# EasyEDA Pro project energymonitor_2025-05-27.epro, schematic Schematic_1, sheets 1 to 3 of 6

## Sheets
1 P1: Board Name: Board_1; Create Date: 2025-04-18; Page Name: P1; Project Name: energymonitor; Schematic Name: Schematic_1; Update Date: 2025-05-05; Company: EasyEDA.com; Drawed: EasyEDA Pro; Page Size: A3; Part Number: JLCPCB-001; Reviewed: EasyEDA Pro; Version: V0.1
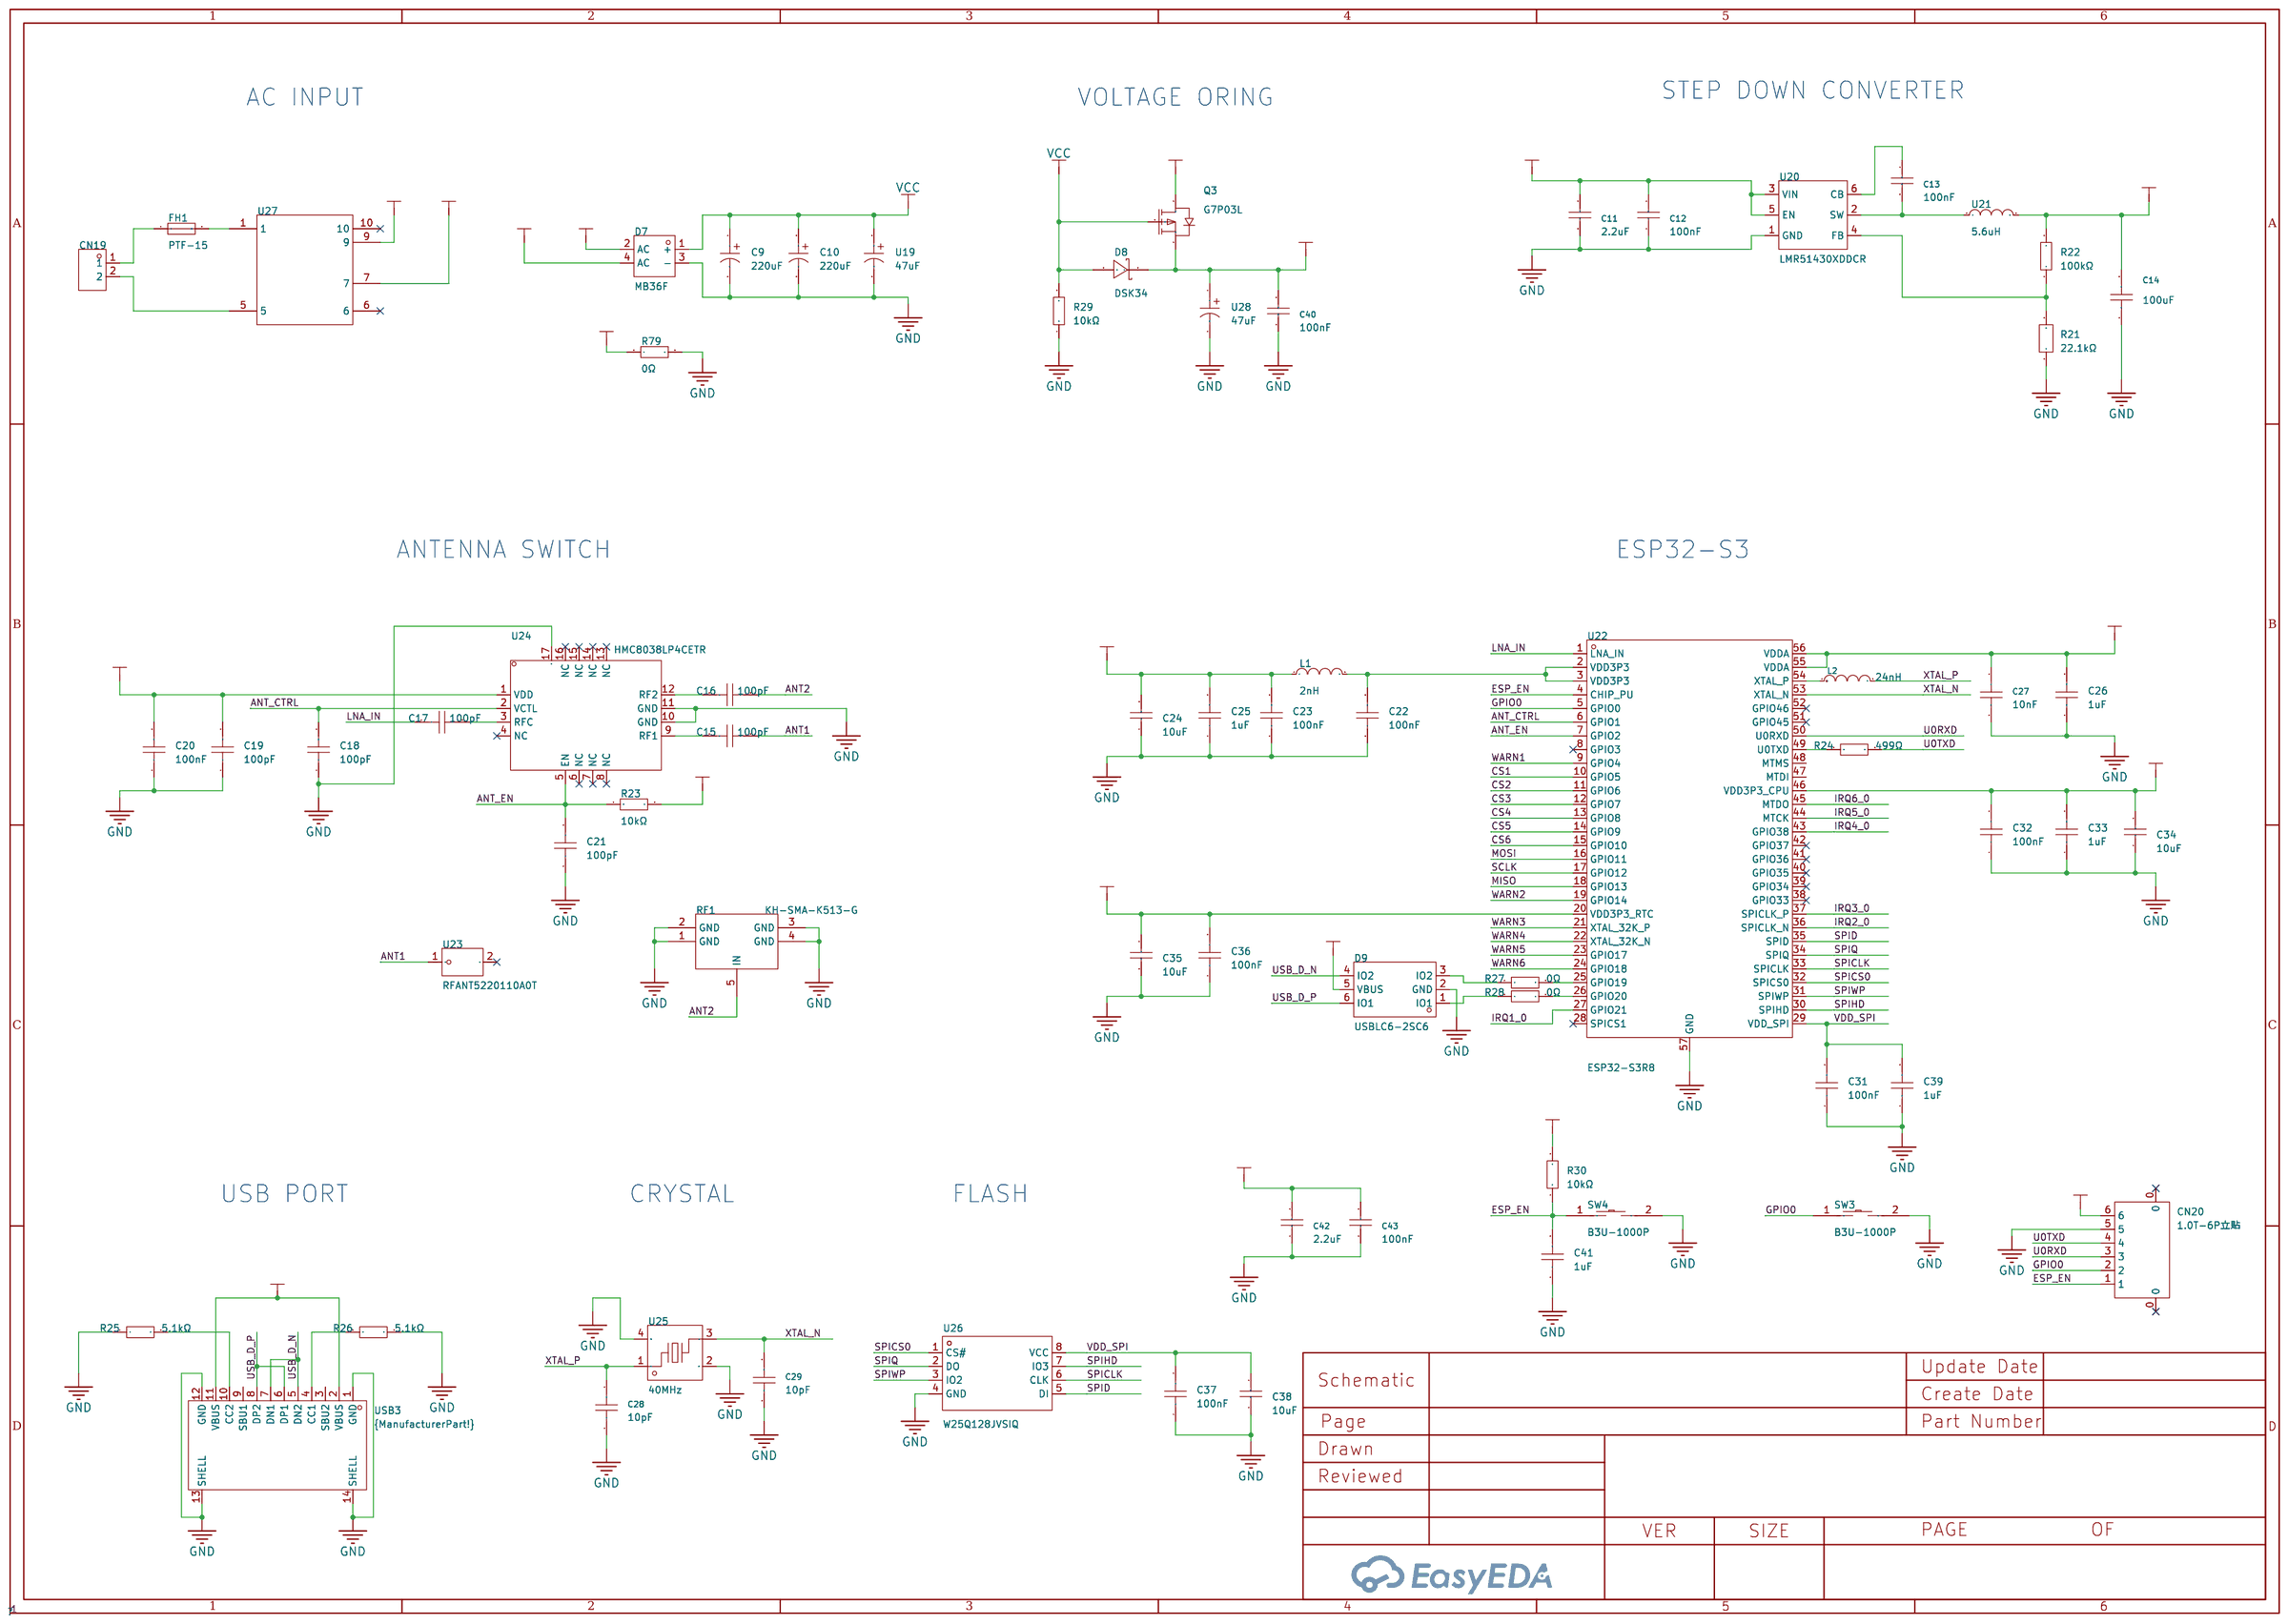
[diagram p0: P1]
2 P2: Page Name: P2; Update Date: 2025-04-23
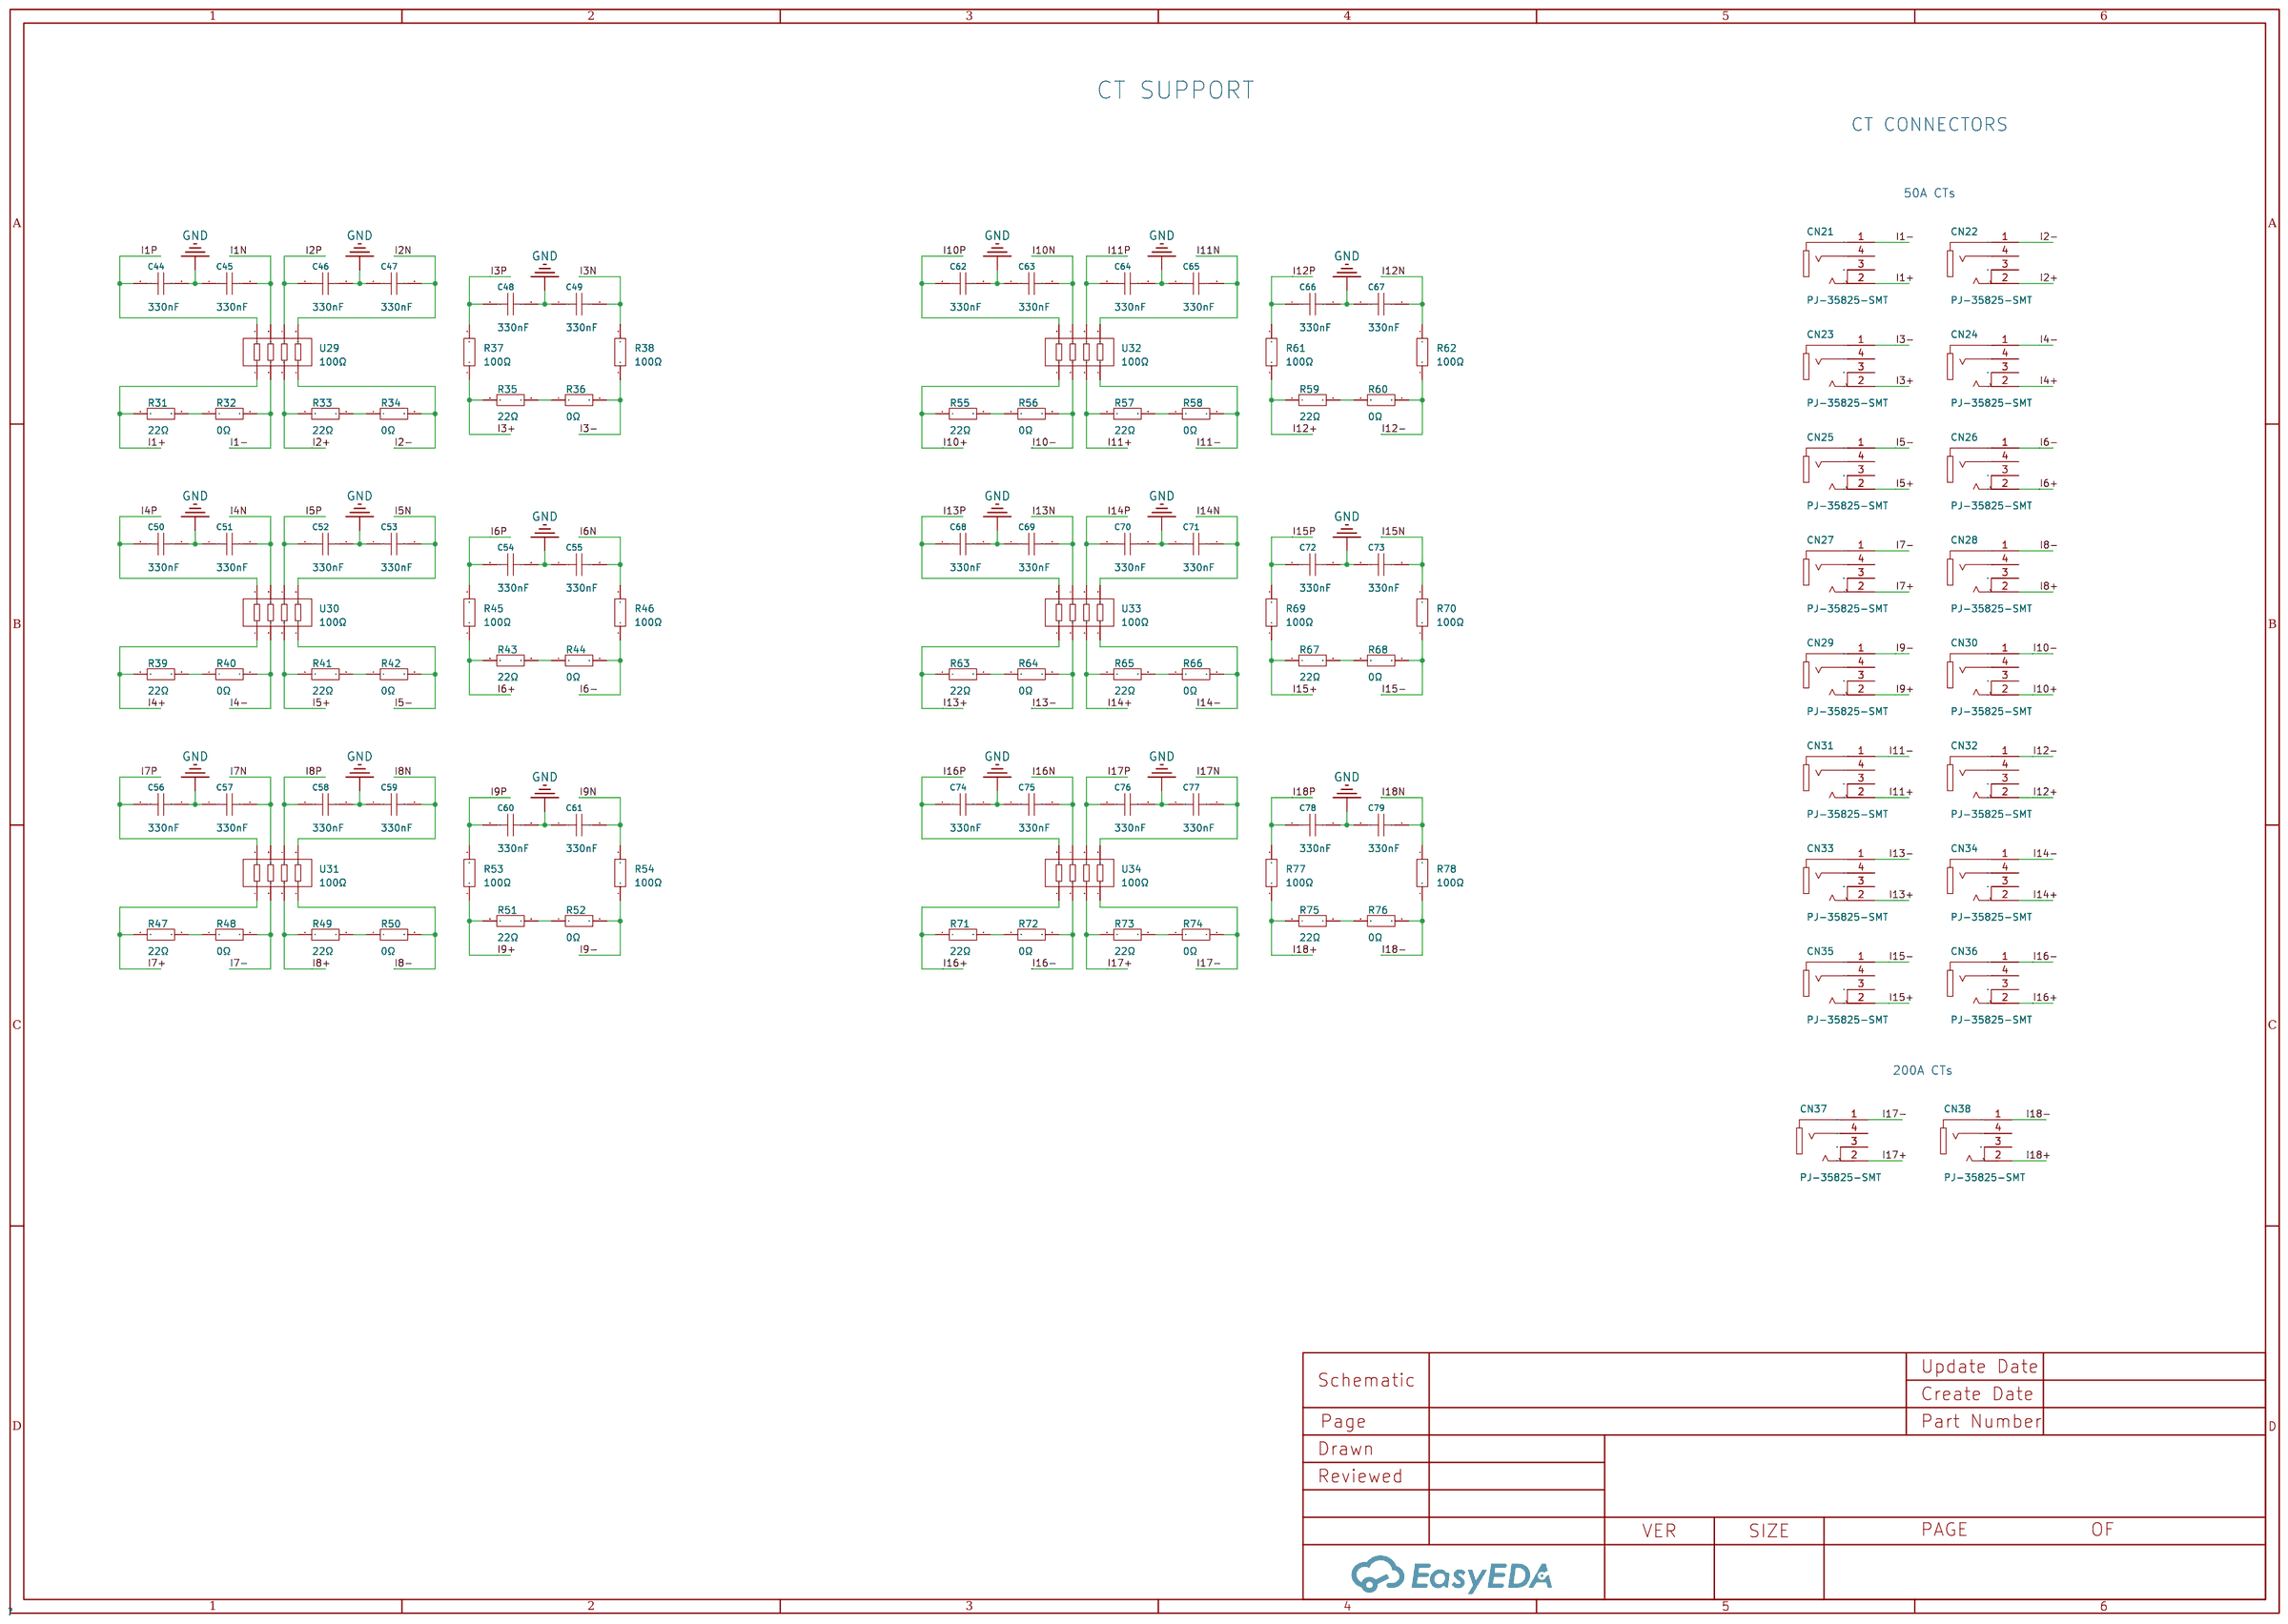
[diagram p1: P2]
3 P3: Create Date: 2025-04-22; Page Name: P3; Update Date: 2025-04-23
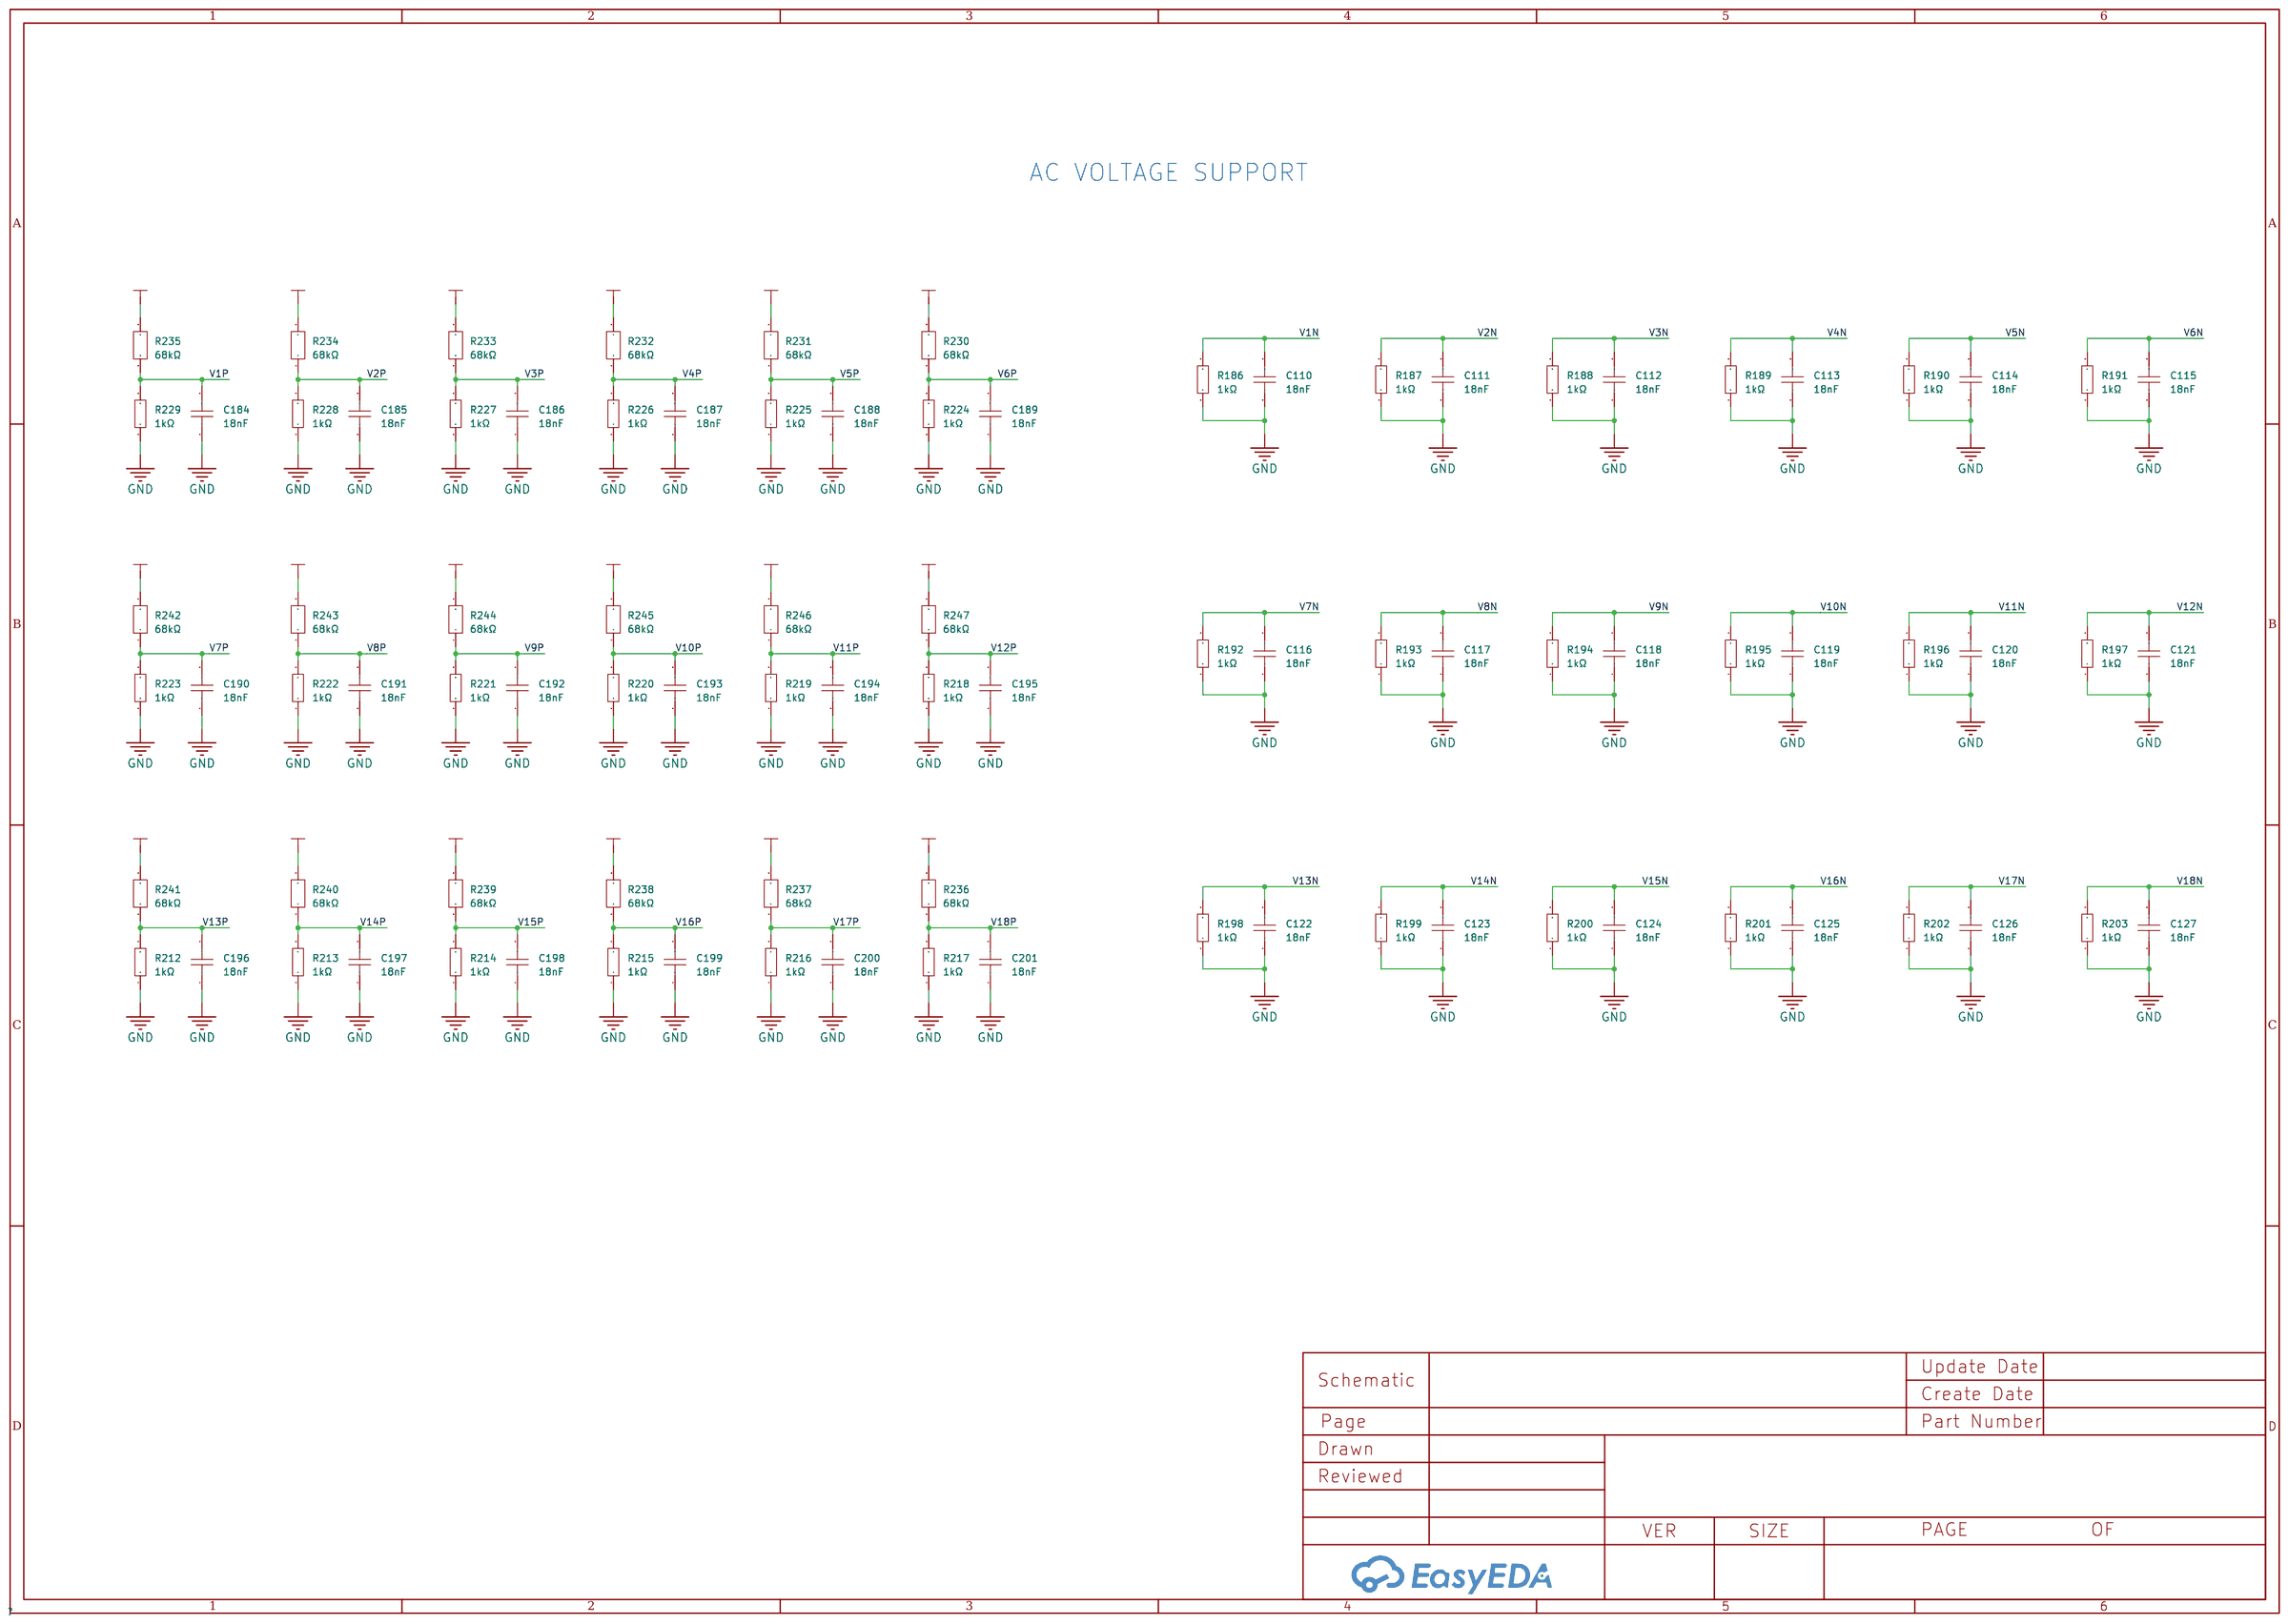
[diagram p2: P3]

## Parts
sheet P1
C9  220uF  [CAP-SMD_BD6.3-L6.6-W6.6-FD]
C10  220uF  [CAP-SMD_BD6.3-L6.6-W6.6-FD]
C11  2.2uF  [C0805]
C12  100nF  [C0805]
C13  100nF  [C0805]
C14  100uF  [C1210]
C15  100pF  [C0402]
C16  100pF  [C0402]
C17  100pF  [C0402]
C18  100pF  [C0402]
C19  100pF  [C0402]
C20  100nF  [C0402]
C21  100pF  [C0402]
C22  100nF  [C0402]
C23  100nF  [C0402]
C24  10uF  [C0402]
C25  1uF  [C0402]
C26  1uF  [C0402]
C27  10nF  [C0402]
C28  10pF  [C0402]
C29  10pF  [C0402]
C31  100nF  [C0402]
C32  100nF  [C0402]
C33  1uF  [C0402]
C34  10uF  [C0402]
C35  10uF  [C0402]
C36  100nF  [C0402]
C37  100nF  [C0402]
C38  10uF  [C0402]
C39  1uF  [C0402]
C40  100nF  [C0805]
C41  1uF  [C0402]
C42  2.2uF  [C0805]
C43  100nF  [C0805]
CN19  DBT50G-6.35-2P-BK-P OGC  [CONN-TH_2P-P6.35_DBT50G-6.35-2P-BK-P]
CN20  1.0T-6P立贴  [CONN-SMD_1.0T-6P-LT]
D7  MB36F  [MBF_L4.8-W3.9-P2.50-LS6.7-TR]
D8  DSK34  [SOD-123_L2.8-W1.8-LS3.7-RD]
D9  USBLC6-2SC6  [SOT-23-6_L2.9-W1.6-P0.95-LS2.8-BL]
FH1  PTF-15  [FUSE-TH_L22.0-W9.0-P22.60]
L1  2nH  [L0402]
L2  24nH  [L0402-RD]
Q3  G7P03L  [SOT-23-3_L2.9-W1.6-P1.90-LS2.8-BR]
R21  22.1kΩ  [R0603]
R22  100kΩ  [R0603]
R23  10kΩ  [R0402]
R24  499Ω  [R0402]
R25  5.1kΩ  [R0402]
R26  5.1kΩ  [R0402]
R27  0Ω  [R0402]
R28  0Ω  [R0402]
R29  10kΩ  [R0402]
R30  10kΩ  [R0402]
R79  0Ω  [R0603]
RF1  KH-SMA-K513-G  [ANT-TH_KH-SMA-K513-G]
SW3  B3U-1000P  [KEY-SMD_B3U-1000PM]
SW4  B3U-1000P  [KEY-SMD_B3U-1000PM]
U19  47uF  [CAP-SMD_BD5.0-L5.3-W5.3-LS6.7-FD]
U20  LMR51430XDDCR  [SOT-23-6_L2.9-W1.6-P0.95-LS2.8-BL]
U21  5.6uH  [IND-SMD_L5.5-W5.3]
U22  ESP32-S3R8  [QFN-56_L7.0-W7.0-P0.40-TL-EP4.0]
U23  RFANT5220110A0T  [FILTER-SMD_L5.2-W2.0-L]
U24  HMC8038LP4CETR  [LFCSP-16_L4.0-W4.0-P0.65-BL-EP]
U25  40MHz  [CRYSTAL-SMD_4P-L2.5-W2.0-BL]
U26  W25Q128JVSIQ  [SOIC-8_L5.3-W5.3-P1.27-LS8.0-BL]
U27  -  [PE3828-M]
U28  47uF  [CAP-SMD_BD5.0-L5.3-W5.3-LS6.7-FD]
USB3  -  [USB-C-SMD_TYPE-C-6PIN-2MD-073]
sheet P2
C44  330nF  [C0603]
C45  330nF  [C0603]
C46  330nF  [C0603]
C47  330nF  [C0603]
C48  330nF  [C0603]
C49  330nF  [C0603]
C50  330nF  [C0603]
C51  330nF  [C0603]
C52  330nF  [C0603]
C53  330nF  [C0603]
C54  330nF  [C0603]
C55  330nF  [C0603]
C56  330nF  [C0603]
C57  330nF  [C0603]
C58  330nF  [C0603]
C59  330nF  [C0603]
C60  330nF  [C0603]
C61  330nF  [C0603]
C62  330nF  [C0603]
C63  330nF  [C0603]
C64  330nF  [C0603]
C65  330nF  [C0603]
C66  330nF  [C0603]
C67  330nF  [C0603]
C68  330nF  [C0603]
C69  330nF  [C0603]
C70  330nF  [C0603]
C71  330nF  [C0603]
C72  330nF  [C0603]
C73  330nF  [C0603]
C74  330nF  [C0603]
C75  330nF  [C0603]
C76  330nF  [C0603]
C77  330nF  [C0603]
C78  330nF  [C0603]
C79  330nF  [C0603]
CN21  PJ-35825-SMT  [AUDIO-SMD_PJ-35825]
CN22  PJ-35825-SMT  [AUDIO-SMD_PJ-35825]
CN23  PJ-35825-SMT  [AUDIO-SMD_PJ-35825]
CN24  PJ-35825-SMT  [AUDIO-SMD_PJ-35825]
CN25  PJ-35825-SMT  [AUDIO-SMD_PJ-35825]
CN26  PJ-35825-SMT  [AUDIO-SMD_PJ-35825]
CN27  PJ-35825-SMT  [AUDIO-SMD_PJ-35825]
CN28  PJ-35825-SMT  [AUDIO-SMD_PJ-35825]
CN29  PJ-35825-SMT  [AUDIO-SMD_PJ-35825]
CN30  PJ-35825-SMT  [AUDIO-SMD_PJ-35825]
CN31  PJ-35825-SMT  [AUDIO-SMD_PJ-35825]
CN32  PJ-35825-SMT  [AUDIO-SMD_PJ-35825]
CN33  PJ-35825-SMT  [AUDIO-SMD_PJ-35825]
CN34  PJ-35825-SMT  [AUDIO-SMD_PJ-35825]
CN35  PJ-35825-SMT  [AUDIO-SMD_PJ-35825]
CN36  PJ-35825-SMT  [AUDIO-SMD_PJ-35825]
CN37  PJ-35825-SMT  [AUDIO-SMD_PJ-35825]
CN38  PJ-35825-SMT  [AUDIO-SMD_PJ-35825]
R31  22Ω  [R0603]
R32  0Ω  [R0603]
R33  22Ω  [R0603]
R34  0Ω  [R0603]
R35  22Ω  [R0603]
R36  0Ω  [R0603]
R37  100Ω  [R0603]
R38  100Ω  [R0603]
R39  22Ω  [R0603]
R40  0Ω  [R0603]
R41  22Ω  [R0603]
R42  0Ω  [R0603]
R43  22Ω  [R0603]
R44  0Ω  [R0603]
R45  100Ω  [R0603]
R46  100Ω  [R0603]
R47  22Ω  [R0603]
R48  0Ω  [R0603]
R49  22Ω  [R0603]
R50  0Ω  [R0603]
R51  22Ω  [R0603]
R52  0Ω  [R0603]
R53  100Ω  [R0603]
R54  100Ω  [R0603]
R55  22Ω  [R0603]
R56  0Ω  [R0603]
R57  22Ω  [R0603]
R58  0Ω  [R0603]
R59  22Ω  [R0603]
R60  0Ω  [R0603]
R61  100Ω  [R0603]
R62  100Ω  [R0603]
R63  22Ω  [R0603]
R64  0Ω  [R0603]
R65  22Ω  [R0603]
R66  0Ω  [R0603]
R67  22Ω  [R0603]
R68  0Ω  [R0603]
R69  100Ω  [R0603]
R70  100Ω  [R0603]
R71  22Ω  [R0603]
R72  0Ω  [R0603]
R73  22Ω  [R0603]
R74  0Ω  [R0603]
R75  22Ω  [R0603]
R76  0Ω  [R0603]
R77  100Ω  [R0603]
R78  100Ω  [R0603]
U29  100Ω  [RES-ARRAY-SMD_0603-8P-L3.2-W1.6-BL]
U30  100Ω  [RES-ARRAY-SMD_0603-8P-L3.2-W1.6-BL]
U31  100Ω  [RES-ARRAY-SMD_0603-8P-L3.2-W1.6-BL]
U32  100Ω  [RES-ARRAY-SMD_0603-8P-L3.2-W1.6-BL]
U33  100Ω  [RES-ARRAY-SMD_0603-8P-L3.2-W1.6-BL]
U34  100Ω  [RES-ARRAY-SMD_0603-8P-L3.2-W1.6-BL]
sheet P3
C110  18nF  [C0603]
C111  18nF  [C0603]
C112  18nF  [C0603]
C113  18nF  [C0603]
C114  18nF  [C0603]
C115  18nF  [C0603]
C116  18nF  [C0603]
C117  18nF  [C0603]
C118  18nF  [C0603]
C119  18nF  [C0603]
C120  18nF  [C0603]
C121  18nF  [C0603]
C122  18nF  [C0603]
C123  18nF  [C0603]
C124  18nF  [C0603]
C125  18nF  [C0603]
C126  18nF  [C0603]
C127  18nF  [C0603]
C184  18nF  [C0603]
C185  18nF  [C0603]
C186  18nF  [C0603]
C187  18nF  [C0603]
C188  18nF  [C0603]
C189  18nF  [C0603]
C190  18nF  [C0603]
C191  18nF  [C0603]
C192  18nF  [C0603]
C193  18nF  [C0603]
C194  18nF  [C0603]
C195  18nF  [C0603]
C196  18nF  [C0603]
C197  18nF  [C0603]
C198  18nF  [C0603]
C199  18nF  [C0603]
C200  18nF  [C0603]
C201  18nF  [C0603]
R186  1kΩ  [R0603]
R187  1kΩ  [R0603]
R188  1kΩ  [R0603]
R189  1kΩ  [R0603]
R190  1kΩ  [R0603]
R191  1kΩ  [R0603]
R192  1kΩ  [R0603]
R193  1kΩ  [R0603]
R194  1kΩ  [R0603]
R195  1kΩ  [R0603]
R196  1kΩ  [R0603]
R197  1kΩ  [R0603]
R198  1kΩ  [R0603]
R199  1kΩ  [R0603]
R200  1kΩ  [R0603]
R201  1kΩ  [R0603]
R202  1kΩ  [R0603]
R203  1kΩ  [R0603]
R212  1kΩ  [R0603]
R213  1kΩ  [R0603]
R214  1kΩ  [R0603]
R215  1kΩ  [R0603]
R216  1kΩ  [R0603]
R217  1kΩ  [R0603]
R218  1kΩ  [R0603]
R219  1kΩ  [R0603]
R220  1kΩ  [R0603]
R221  1kΩ  [R0603]
R222  1kΩ  [R0603]
R223  1kΩ  [R0603]
R224  1kΩ  [R0603]
R225  1kΩ  [R0603]
R226  1kΩ  [R0603]
R227  1kΩ  [R0603]
R228  1kΩ  [R0603]
R229  1kΩ  [R0603]
R230  68kΩ  [R0603]
R231  68kΩ  [R0603]
R232  68kΩ  [R0603]
R233  68kΩ  [R0603]
R234  68kΩ  [R0603]
R235  68kΩ  [R0603]
R236  68kΩ  [R0603]
R237  68kΩ  [R0603]
R238  68kΩ  [R0603]
R239  68kΩ  [R0603]
R240  68kΩ  [R0603]
R241  68kΩ  [R0603]
R242  68kΩ  [R0603]
R243  68kΩ  [R0603]
R244  68kΩ  [R0603]
R245  68kΩ  [R0603]
R246  68kΩ  [R0603]
R247  68kΩ  [R0603]

## Library data of the parts
C9 C10 = 189RV0019: Capacitance:220uF Tolerance:±20% Tolerance:±20% Voltage Rating:35V Ripple Current:600mA@100KHz Equivalent Series Resistance(ESR):160mΩ@100KHz Diameter:6.3mm Height - Seated (Max):7.7mm Lifetime:2000hrs@105℃ Operating Temperature:-55℃~+105℃ Operating Tempe; LCSC Part Name: 220uF ±20% 35V; Supplier Part: C7471881; Manufacturer: KNSCHA(科尼盛); Supplier Footprint: SMD,D6.3xL7.7mm; JLCPCB Part Class: Extended Part; Datasheet: https://atta.szlcsc.com/upload/public/pdf/source/20230907/E1EFA38CB5E88857ECE494F7E9D8FBCC.pdf; Supplier: LCSC; Tolerance: ±20%; Voltage Rating: 35V; Ripple Current: 600mA@100KHz; Equivalent Series Resistance(ESR): 160mΩ@100KHz; Diameter: 6.3mm; Height - Seated (Max): 7.7mm; Lifetime: 2000hrs@105℃; Operating Temperature: -55℃~+105℃
C11 C42 = CC0805KKX7R9BB225: Capacitance: Tolerance:±10% Tolerance:±10% Voltage Rated: Temperature Coefficient:; LCSC Part Name: 2.2uF ±10% 50V; Supplier Part: C125847; Manufacturer: YAGEO(国巨); Supplier Footprint: 0805; JLCPCB Part Class: Extended Part; Datasheet: https://atta.szlcsc.com/upload/public/pdf/source/20181008/C309510_22F155564471FAF6A489F7D68F34234E.pdf; Supplier: LCSC; Tolerance: ±10%
C12 C13 C40 C43 = CC0805JRX7R9BB104: Capacitance: Tolerance:±5% Tolerance:±5% Voltage Rated: Temperature Coefficient:; LCSC Part Name: 100nF ±5% 50V; Supplier Part: C111492; Manufacturer: YAGEO(国巨); Supplier Footprint: 0805; JLCPCB Part Class: Extended Part; Datasheet: https://atta.szlcsc.com/upload/public/pdf/source/20170712/C111492_1499832266087814220.pdf; Supplier: LCSC; Tolerance: ±5%
C14 = GRM32EC70J107ME15L: Capacitance: Tolerance:±20% Tolerance:±20% Voltage Rated: Temperature Coefficient:; LCSC Part Name: 100uF ±20% 6.3V; Supplier Part: C393041; Manufacturer: muRata(村田); Supplier Footprint: 1210; JLCPCB Part Class: Extended Part; Datasheet: https://atta.szlcsc.com/upload/public/pdf/source/20190709/C393041_CEB93739F368E25BFA3DE0E29C732BA6.pdf; Supplier: LCSC; Tolerance: ±20%
C15-C19 C21 = AQ0402JRNPO9BN101: Capacitance: Tolerance:±5% Tolerance:±5% Voltage Rated: Temperature Coefficient:; LCSC Part Name: 100pF ±5% 50V; Supplier Part: C3852421; Manufacturer: YAGEO(国巨); Supplier Footprint: 0402; JLCPCB Part Class: Extended Part; Datasheet: https://atta.szlcsc.com/upload/public/pdf/source/20231127/92798457EE2E8369C5881DCE70D14207.pdf; Supplier: LCSC; Tolerance: ±5%
C20 C22 C23 C31 C32 C36 C37 = CC0402JRX7R7BB104: Capacitance: Tolerance:±5% Tolerance:±5% Voltage Rated: Temperature Coefficient:; LCSC Part Name: 100nF ±5% 16V; Supplier Part: C541464; Manufacturer: YAGEO(国巨); Supplier Footprint: 0402; JLCPCB Part Class: Extended Part; Datasheet: https://atta.szlcsc.com/upload/public/pdf/source/20200615/C541464_B57AABC9570B6B2CE091E735F96B12C0.pdf; Supplier: LCSC; Tolerance: ±5%
C24 C34 C35 C38 = CC0402MRX5R5BB106: Capacitance: Tolerance:±20% Tolerance:±20% Voltage Rated: Temperature Coefficient:; LCSC Part Name: 10uF ±20% 6.3V; Supplier Part: C105884; Manufacturer: YAGEO(国巨); Supplier Footprint: 0402; JLCPCB Part Class: Extended Part; Datasheet: https://atta.szlcsc.com/upload/public/pdf/source/20181008/C309506_01C87B2C86DBD1236B532041A9B60642.pdf; Supplier: LCSC; Tolerance: ±20%
C25 C26 C33 C39 C41 = CC0402KRX5R6BB105: Capacitance: Tolerance:±10% Tolerance:±10% Voltage Rated: Temperature Coefficient:; LCSC Part Name: 1uF ±10% 10V; Supplier Part: C106254; Manufacturer: YAGEO(国巨); Supplier Footprint: 0402; JLCPCB Part Class: Extended Part; Datasheet: https://atta.szlcsc.com/upload/public/pdf/source/20170914/C128857_1505359892143968080.pdf; Supplier: LCSC; Tolerance: ±10%
C27 = CC0402KRX7R8BB103: Capacitance: Tolerance:±10% Tolerance:±10% Voltage Rated: Temperature Coefficient:; LCSC Part Name: 10nF ±10% 25V; Supplier Part: C327025; Manufacturer: YAGEO(国巨); Supplier Footprint: 0402; JLCPCB Part Class: Extended Part; Datasheet: https://atta.szlcsc.com/upload/public/pdf/source/20181031/C327025_BF09B1A7BE38D1441B1B31A410B80C1A.pdf; Supplier: LCSC; Tolerance: ±10%
C28 C29 = CC0402FRNPO9BN100: Capacitance: Tolerance:±1% Tolerance:±1% Voltage Rated: Temperature Coefficient:; LCSC Part Name: 10pF ±1% 50V; Supplier Part: C513681; Manufacturer: YAGEO(国巨); Supplier Footprint: 0402; JLCPCB Part Class: Extended Part; Datasheet: https://atta.szlcsc.com/upload/public/pdf/source/20200415/C513681_5027FF1861A780E76D33CC24CC34CA99.pdf; Supplier: LCSC; Tolerance: ±1%
CN19 = DBT50G-6.35-2P-BK-P OGC: Barrier Type:Tri-face Pitch:6.35mm Structure:1x2P Pin Location:Corner Number of Pins:2P Number of Rows:1 Number of PINs Per Row:2 Current Rating (Max):10A Voltage Rating (Max):300V Wire Gauge - AWG:22~16 Operating Temperature Range:-40℃~+105℃ Operating Te; LCSC Part Name: 6.35mm 1x2P 边脚 排数:1 每排P数:2; Supplier Part: C5179471; Manufacturer: DORABO(地博电气); Supplier Footprint: 插件,P=6.35mm; JLCPCB Part Class: Extended Part; Datasheet: https://atta.szlcsc.com/upload/public/pdf/source/20220926/26AF35D9D258DE9AFF244000D2C3D119.pdf; Supplier: LCSC; Barrier Type: Tri-face; Pitch: 6.35mm; Structure: 1x2P; Pin Location: Corner; Number of Pins: 2P; Number of Rows: 1; Number of PINs Per Row: 2; Current Rating (Max): 10A; Voltage Rating (Max): 300V; Wire Gauge - AWG: 22~16; Operating Temperature Range: -40℃~+105℃; Color: Black
CN20 = 1.0T-6P立贴: Pins Structure:1x6P Pitch:1mm Mounting Type:Standing paste Reference Series:SH Number of Pins:6P Number of Rows:1 Number of PINs Per Row:6 Row Spacing:- Current Rating:- Contact Material:- Contact Plating:- Operating Temperature:- Operating Temperature:-; LCSC Part Name: 1x6P 间距:1mm 立贴 系列:SH; Supplier Part: C145963; Manufacturer: BOOMELE(博穆精密); Supplier Footprint: SMD,P=1mm; JLCPCB Part Class: Extended Part; Datasheet: https://atta.szlcsc.com/upload/public/pdf/source/20171202/C145963_15122106156871160209.pdf; Supplier: LCSC; Pins Structure: 1x6P; Pitch: 1mm; Mounting Type: Standing paste; Reference Series: SH; Number of Pins: 6P; Number of Rows: 1; Number of PINs Per Row: 6
D7 = MB36F: Voltage - Forward(Vf@If):700mV@3A Voltage - DC Reverse(Vr):60V Current - Rectified:3A Reverse Leakage Current (Ir):0.3mA@60V Peak Forward Surge Current:- Operating Temperature:-55℃~+150℃@(Tj) Operating Temperature:-55℃~+150℃@(Tj); LCSC Part Name: 电压:60V 电流:3A; Supplier Part: C5807949; Manufacturer: GOODWORK(固得沃克); Supplier Footprint: MBF; JLCPCB Part Class: Extended Part; Datasheet: https://atta.szlcsc.com/upload/public/pdf/source/20230915/052BDBA17746B948596B5571E1F2C691.pdf; Supplier: LCSC; Voltage - Forward(Vf@If): 700mV@3A; Voltage - DC Reverse(Vr): 60V; Current - Rectified: 3A; Reverse Leakage Current (Ir): 0.3mA@60V; Operating Temperature: -55℃~+150℃@(Tj)
D8 = DSK34_C41029: Diode Configuration:Independent Type Forward Voltage (Vf@If):550mV@3A Reverse Voltage (Vr):40V Rectified Current:3A Reverse Leakage Current (Ir):500uA@40V; LCSC Part Name: 电压:40V 电流:3A; Supplier Part: C41029; Manufacturer: MDD(辰达半导体); Supplier Footprint: SOD-123FL; JLCPCB Part Class: Extended Part; Datasheet: https://atta.szlcsc.com/upload/public/pdf/source/20240710/931B7979AEEE628A0AE48522F9F6A0BB.pdf; Supplier: LCSC; Diode Configuration: Independent Type; Forward Voltage (Vf@If): 550mV@3A; Reverse Voltage (Vr): 40V; Rectified Current: 3A; Reverse Leakage Current (Ir): 500uA@40V
D9 = USBLC6-2SC6_C2827654: polarity:Unidirectional Reverse Stand-Off Voltage (Vrwm):5V Maximum Clamping Voltage:12V Peak Pulse Current (Ipp):6A Peak Pulse Power Dissipation (Ppp):150W Breakdown Voltage:6V Reverse Leakage Current (Ir):80nA Number of Lines:Dual channel Operating Temp; LCSC Part Name: ESD，可防30kV静电; Supplier Part: C2827654; Manufacturer: TECH PUBLIC(台舟); Supplier Footprint: SOT-23-6; JLCPCB Part Class: Extended Part; Datasheet: https://atta.szlcsc.com/upload/public/pdf/source/20210810/FBD75DE717D6D97BAC6DD7F2B5C09DCD.pdf; Supplier: LCSC; polarity: Unidirectional; Reverse Stand-Off Voltage (Vrwm): 5V; Maximum Clamping Voltage: 12V; Peak Pulse Current (Ipp): 6A; Peak Pulse Power Dissipation (Ppp): 150W; Breakdown Voltage: 6V; Reverse Leakage Current (Ir): 80nA; Number of Lines: Dual channel; Operating Temperature: -55℃~+125℃; level of protection: IEC 61000-4-2; Type: ESD
FH1 = PTF-15: Fuseholder Type:- Voltage Rating:250V Current Rating:6.3A Fuse Type:- Fuse Size:-; LCSC Part Name: 保险丝座 5x20mm 白色盖 二件套 两件套; Supplier Part: C842712; Manufacturer: XFCN(兴飞); JLCPCB Part Class: Extended Part; Datasheet: https://atta.szlcsc.com/upload/public/pdf/source/20211009/012EEC364944A1D424B5148AD750D865.pdf; Supplier: LCSC; Voltage Rating: 250V; Current Rating: 6.3A
L1 = MLG1005S2N0BT000: Inductance: Tolerance:- Tolerance:- Current Rating: Current - Saturation (Isat):- DC Resistance(DCR): Q @ Frequency:7@100MHz Frequency - Self Resonant: Ratings:; LCSC Part Name: ±0.1nH 2nH; Supplier Part: C76769; Manufacturer: TDK; Supplier Footprint: 0402; JLCPCB Part Class: Extended Part; Datasheet: https://atta.szlcsc.com/upload/public/pdf/source/20240116/5498F69597B6145D9954BDAE22913204.pdf; Supplier: LCSC; Q @ Frequency: 7@100MHz
L2 = MLG1005S24NHTD25: Inductance: Tolerance:±3% Tolerance:±3% Rated Current: Saturation Current (Isat):- DC Resistance (DCR): Q @ Freq:8@100MHz Frequency - Self Resonant: Ratings:AEC-Q200 Type:叠层电感; LCSC Part Name: 24nH ±3%; Supplier Part: C404641; Manufacturer: TDK; Supplier Footprint: 0402; JLCPCB Part Class: Extended Part; Datasheet: https://atta.szlcsc.com/upload/public/pdf/source/20190827/C404670_BFC18E2387CC73352FB6CA4EEBA9A81C.pdf; Supplier: LCSC; Tolerance: ±3%; Q @ Freq: 8@100MHz; Ratings: AEC-Q200; Type: 叠层电感
Q3 = G7P03L: Type:1个PChannel Drain Source Voltage (Vdss): Continuous Drain Current (Id): Power Dissipation (Pd): Drain Source On Resistance (RDS(on)@Vgs,Id):19mΩ Gate Threshold Voltage (Vgs(th)@Id): Total Gate Charge (Qg@Vgs):29nC@10V Input Capacitance (Ciss@Vds):1.5n; LCSC Part Name: 1个P沟道 耐压:30V 电流:7A; Supplier Part: C840062; Manufacturer: GOFORD(谷峰); Supplier Footprint: SOT-23-3L; JLCPCB Part Class: Extended Part; Datasheet: https://atta.szlcsc.com/upload/public/pdf/source/20221223/92C0B711CE44AE885DF507E73EDA798E.pdf; Supplier: LCSC; Type: 1个PChannel; Drain Source On Resistance (RDS(on)@Vgs,Id): 19mΩ; Total Gate Charge (Qg@Vgs): 29nC@10V; Input Capacitance (Ciss@Vds): 1.5nF@15V; Operating Temperature: -55℃~+150℃@(Tj)
R21 = RT0603BRD0722K1L: Type:Thin Film Resistor Resistance: Tolerance:±0.1% Tolerance:±0.1% Power(Watts): Overload Voltage (Max): Temperature Coefficient:±25ppm/℃ Temperature Coefficient:±25ppm/℃ Operating Temperature Range:-55℃~+155℃ Operating Temperature Range:-55℃~+155℃; LCSC Part Name: 薄膜电阻 22.1kΩ ±0.1% 100mW; Supplier Part: C723484; Manufacturer: YAGEO(国巨); Supplier Footprint: 0603; JLCPCB Part Class: Extended Part; Datasheet: https://atta.szlcsc.com/upload/public/pdf/source/20200814/C723484_3ED6ED36B515712CEA3D5F9ED2377AB6.pdf; Supplier: LCSC; Type: Thin Film Resistor; Tolerance: ±0.1%; Temperature Coefficient: ±25ppm/℃; Operating Temperature Range: -55℃~+155℃
R22 = RT0603BRE07100KL: Type:Thin Film Resistor Resistance: Tolerance:±0.1% Tolerance:±0.1% Power(Watts): Overload Voltage (Max): Temperature Coefficient:±50ppm/℃ Temperature Coefficient:±50ppm/℃ Operating Temperature Range:-55℃~+155℃ Operating Temperature Range:-55℃~+155℃; LCSC Part Name: 薄膜电阻 100kΩ ±0.1% 100mW; Supplier Part: C326758; Manufacturer: YAGEO(国巨); Supplier Footprint: 0603; JLCPCB Part Class: Extended Part; Datasheet: https://atta.szlcsc.com/upload/public/pdf/source/20181031/C326758_29924CAA275546702F4E1B334BE68F89.pdf; Supplier: LCSC; Type: Thin Film Resistor; Tolerance: ±0.1%; Temperature Coefficient: ±50ppm/℃; Operating Temperature Range: -55℃~+155℃
R23 R29 R30 = RC0402FR-0710KL: Type:Thick Film Resistors Resistance: Tolerance:±1% Tolerance:±1% Power(Watts): Overload Voltage (Max): Temperature Coefficient:±100ppm/℃ Temperature Coefficient:±100ppm/℃ Operating Temperature Range:-55℃~+155℃ Operating Temperature Range:-55℃~+155℃; LCSC Part Name: 厚膜电阻 10kΩ ±1% 62.5mW; Supplier Part: C60490; Manufacturer: YAGEO(国巨); Supplier Footprint: 0402; JLCPCB Part Class: Extended Part; Datasheet: https://atta.szlcsc.com/upload/public/pdf/source/20170925/C131467_1506321478108990263.pdf; Supplier: LCSC; Type: Thick Film Resistors; Tolerance: ±1%; Temperature Coefficient: ±100ppm/℃; Operating Temperature Range: -55℃~+155℃
R24 = RC0402FR-07499RL: Type:Thick Film Resistors Resistance: Tolerance:±1% Tolerance:±1% Power(Watts): Overload Voltage (Max): Temperature Coefficient:±100ppm/℃ Temperature Coefficient:±100ppm/℃ Operating Temperature Range:-55℃~+155℃ Operating Temperature Range:-55℃~+155℃; LCSC Part Name: 厚膜电阻 499Ω ±1% 62.5mW; Supplier Part: C137970; Manufacturer: YAGEO(国巨); Supplier Footprint: 0402; JLCPCB Part Class: Extended Part; Datasheet: https://atta.szlcsc.com/upload/public/pdf/source/20181009/C309620_DA5935B6E1D48212CB7A533FE518B3C2.pdf; Supplier: LCSC; Type: Thick Film Resistors; Tolerance: ±1%; Temperature Coefficient: ±100ppm/℃; Operating Temperature Range: -55℃~+155℃
R25 R26 = RC0402FR-075K1L: Type:Thick Film Resistors Resistance: Tolerance:±1% Tolerance:±1% Power(Watts): Overload Voltage (Max): Temperature Coefficient:±100ppm/℃ Temperature Coefficient:±100ppm/℃ Operating Temperature Range:-55℃~+155℃ Operating Temperature Range:-55℃~+155℃; LCSC Part Name: 厚膜电阻 5.1kΩ ±1% 62.5mW; Supplier Part: C105872; Manufacturer: YAGEO(国巨); Supplier Footprint: 0402; JLCPCB Part Class: Extended Part; Datasheet: https://atta.szlcsc.com/upload/public/pdf/source/20180821/C275644_0D56F95EFF785E7D9A1FEF436B37DA78.pdf; Supplier: LCSC; Type: Thick Film Resistors; Tolerance: ±1%; Temperature Coefficient: ±100ppm/℃; Operating Temperature Range: -55℃~+155℃
R27 R28 = RC0402FR-070RL: Type:Thick Film Resistors Resistance: Tolerance:±1% Tolerance:±1% Power(Watts): Overload Voltage (Max): Temperature Coefficient:- Temperature Coefficient:- Operating Temperature Range:-55℃~+155℃ Operating Temperature Range:-55℃~+155℃; LCSC Part Name: 厚膜电阻 0Ω ±1% 62.5mW; Supplier Part: C106231; Manufacturer: YAGEO(国巨); Supplier Footprint: 0402; JLCPCB Part Class: Extended Part; Datasheet: https://atta.szlcsc.com/upload/public/pdf/source/20180927/C295883_E8D83085EA81BD7DE0B2B681138C15EE.pdf; Supplier: LCSC; Type: Thick Film Resistors; Tolerance: ±1%; Operating Temperature Range: -55℃~+155℃
R32 R34 R36 R40 R42 R44 R48 R50 R52 R56 R58 R60 R64 R66 R68 R72 R74 R76 R79 = RC0603FR-070RL: Type:Thick Film Resistors Resistance: Tolerance:±1% Tolerance:±1% Power(Watts): Overload Voltage (Max): Temperature Coefficient:- Temperature Coefficient:- Operating Temperature Range:-55℃~+155℃ Operating Temperature Range:-55℃~+155℃; LCSC Part Name: 厚膜电阻 0Ω ±1% 100mW; Supplier Part: C100044; Manufacturer: YAGEO(国巨); Supplier Footprint: 0603; JLCPCB Part Class: Extended Part; Datasheet: https://atta.szlcsc.com/upload/public/pdf/source/20180316/70C0E2BDAE7FCC62C531A5A58D202EE1.pdf; Supplier: LCSC; Type: Thick Film Resistors; Tolerance: ±1%; Operating Temperature Range: -55℃~+155℃
RF1 = KH-SMA-K513-G: Connector Type:板端 Interface Type:内孔 Number of Ports:1 Interface Diameter:- Interface Length/Height:- Frequency-Max:6GHz RF Series:SMA Impedance:50Ω Style:弯头 Operating Temperature Range:-55℃~+155℃ Operating Temperature Range:-55℃~+155℃; LCSC Part Name: SMA 内孔 弯头; Supplier Part: C411575; Manufacturer: kinghelm(金航标); Supplier Footprint: 插件; JLCPCB Part Class: Extended Part; Datasheet: https://atta.szlcsc.com/upload/public/pdf/source/20210317/C411575_49039CD64129040639EC5218E5A2C783.pdf; Supplier: LCSC; Connector Type: 板端; Interface Type: 内孔; Number of Ports: 1; Frequency-Max: 6GHz; RF Series: SMA; Impedance: 50Ω; Style: 弯头; Operating Temperature Range: -55℃~+155℃
SW3 SW4 = B3U-1000P_C231329: Circuit:SPST Actuator Style:Round Button Operating Force:153gf Mounting Style:Standing paste Switch Length:3mm Switch Width:2.5mm Switch Height:1.6mm Contact Current:50mA Voltage Rating (DC):12V With Lamp:- Pin Style:SMDSplicing Mechanical Life:- Operatin; LCSC Part Name: 3*2.5*1.6mm 立贴 轻触开关; Supplier Part: C231329; Manufacturer: OMRON(欧姆龙); Supplier Footprint: SMD,2.5x3mm; JLCPCB Part Class: Extended Part; Supplier: LCSC; Circuit: SPST; Actuator Style: Round Button; Operating Force: 153gf; Mounting Style: Standing paste; Switch Length: 3mm; Switch Width: 2.5mm; Switch Height: 1.6mm; Contact Current: 50mA; Voltage Rating (DC): 12V; Pin Style: SMDSplicing; Operating Temperature: -25℃~+70℃
U19 U28 = 189RV0006: Capacitance:47uF Tolerance:±20% Tolerance:±20% Voltage Rating:35V Ripple Current:95mA@100KHz Equivalent Series Resistance(ESR):1.8Ω@100KHz Diameter:5mm Height - Seated (Max):5.7mm Lifetime:2000hrs@105℃ Operating Temperature:-55℃~+105℃ Operating Temperatur; LCSC Part Name: 47uF ±20% 35V; Supplier Part: C7471868; Manufacturer: KNSCHA(科尼盛); Supplier Footprint: SMD,D5xL5.7mm; JLCPCB Part Class: Extended Part; Datasheet: https://atta.szlcsc.com/upload/public/pdf/source/20230907/706DC9219C6582ABBD964609DA190FD2.pdf; Supplier: LCSC; Tolerance: ±20%; Voltage Rating: 35V; Ripple Current: 95mA@100KHz; Equivalent Series Resistance(ESR): 1.8Ω@100KHz; Diameter: 5mm; Height - Seated (Max): 5.7mm; Lifetime: 2000hrs@105℃; Operating Temperature: -55℃~+105℃
U20 = LMR51430XDDCR: Function:Step-down type Output Type:Adjustable Input Voltage:4.5V~36V Input Voltage:4.5V~36V Output Voltage:600mV~34.2V Output Voltage:600mV~34.2V Output Current:3A Switching Frequency:500kHz Switching Frequency:500kHz Operating Temperature:-40℃~+150℃@(TJ; Supplier Part: C5185863; Manufacturer: TI(德州仪器); Supplier Footprint: SOT-23-6; JLCPCB Part Class: Extended Part; Datasheet: https://atta.szlcsc.com/upload/public/pdf/source/20230921/08B58E2AF399A3B97C2B554B7DCF8130.pdf; Supplier: LCSC; Function: Step-down type; Output Type: Adjustable; Input Voltage: 4.5V~36V; Output Voltage: 600mV~34.2V; Output Current: 3A; Switching Frequency: 500kHz; Operating Temperature: -40℃~+150℃@(TJ); Synchronous Rectification: Yes; Number of Outputs: 1; Topology: Step-down; Switch tube (built-in/external): Built-in
U21 = FEXL0550A-5R6M: Inductance:5.6uH Tolerance:±20% Tolerance:±20% Current Rating:7.2A Current - Saturation(Isat):8.6A DC Resistance(DCR):24.2mΩ Type:Winding Inductor Ratings:AEC-Q200; LCSC Part Name: 5.6uH ±20% 8.6A 合金扁线超大电流，一体成型电感; Supplier Part: C5378514; Manufacturer: cjiang(长江微电); Supplier Footprint: SMD,5.5x5.3mm; JLCPCB Part Class: Extended Part; Datasheet: https://atta.szlcsc.com/upload/public/pdf/source/20240409/B9FA7ECCC3220F3F7C7BE8F7B1FCE238.pdf; Supplier: LCSC; Tolerance: ±20%; Current Rating: 7.2A; Current - Saturation(Isat): 8.6A; DC Resistance(DCR): 24.2mΩ; Type: Winding Inductor; Ratings: AEC-Q200
U22 = ESP32-S3R8: Frequency Range:2.412GHz~2.484GHz Frequency Range:2.412GHz~2.484GHz Interface:I2C,I2S,SPI,UART,USB Operating Voltage:3.3V Operating Voltage:3.3V Applications:Bluetooth；WiFi Output Power:21dBm Data Rate:150Mbps Sensitivity:-98.4dBm Operating Temperature:-4; Supplier Part: C2913194; Manufacturer: ESPRESSIF(乐鑫); Supplier Footprint: QFN-56(7x7); JLCPCB Part Class: Extended Part; Datasheet: https://atta.szlcsc.com/upload/public/pdf/source/20231007/CDA236FFCB3F25B7D5220D2CA9867287.pdf; Supplier: LCSC; Frequency Range: 2.412GHz~2.484GHz; Interface: I2C,I2S,SPI,UART,USB; Operating Voltage: 3.3V; Applications: Bluetooth；WiFi; Output Power: 21dBm; Data Rate: 150Mbps; Sensitivity: -98.4dBm; Operating Temperature: -40℃~+85℃
U23 = RFANT5220110A0T: Central Frequency:2.45GHz Peak Gain:2dBi Peak Gain:2dBi Power capacity:5W VSWR:2; Supplier Part: C127611; Manufacturer: Walsin(华新科); Supplier Footprint: SMD,2x5.2mm; JLCPCB Part Class: Extended Part; Datasheet: https://atta.szlcsc.com/upload/public/pdf/source/20180326/C127611_CAA3DCCF3A021118096CAD99FC50242A.pdf; Supplier: LCSC; Central Frequency: 2.45GHz; Peak Gain: 2dBi; Power capacity: 5W; VSWR: 2
U24 = HMC8038LP4CETR: isolation:60dB Insertion loss:0.8dB Frequency range:100MHz~6GHz Frequency range:100MHz~6GHz Supply voltage:3.3V~5V Supply voltage:3.3V~5V operating temperature:-40℃~+105℃ operating temperature:-40℃~+105℃; LCSC Part Name: 高隔离度非反射型0.1 GHz至6.0 GHz硅基SPDT开关; Supplier Part: C208270; Manufacturer: ADI(亚德诺); Supplier Footprint: LFCSP-16(4x4); JLCPCB Part Class: Extended Part; Datasheet: https://atta.szlcsc.com/upload/public/pdf/source/20180424/C208270_4F5C5F1A95269DA4982496B72ACCA2BB.pdf; Supplier: LCSC; isolation: 60dB; Insertion loss: 0.8dB; Frequency range: 100MHz~6GHz; Supply voltage: 3.3V~5V; operating temperature: -40℃~+105℃
U25 = X252040MMB4SI: Type:Surface Mount Crystal Frequency:40MHz Normal temperature Frequency Tolerance:±10ppm Normal temperature Frequency Tolerance:±10ppm Load Capacitance: Frequency Stability:±20ppm Frequency Stability:±20ppm Operating Temperature:-40℃~+85℃ Operating Temper; LCSC Part Name: 40MHz ±10ppm 10pF; Supplier Part: C2885592; Manufacturer: YXC(扬兴晶振); Supplier Footprint: SMD2520-4P; JLCPCB Part Class: Extended Part; Datasheet: https://atta.szlcsc.com/upload/public/pdf/source/20240329/8B53C0AFBC5BB264DFB5D72B3757797A.pdf; Supplier: LCSC; Type: Surface Mount Crystal; Normal temperature Frequency Tolerance: ±10ppm; Frequency Stability: ±20ppm; Operating Temperature: -40℃~+85℃
U26 = W25Q128JVSIQ: Interface Type:SPI Memory Size:128Mbit Clock Frequency (fc):133MHz Supply Voltage:2.7V~3.6V Supply Voltage:2.7V~3.6V Page Programming Time (Tpp):700us Block Erase Time (tBE):120ms@(32KB) Data Retention - TDR (Year):20 years Operating Temperature:-40℃~+85℃; LCSC Part Name: W25Q128JVSIQ 编带; Supplier Part: C97521; Manufacturer: WINBOND(华邦); Supplier Footprint: SOIC-8-208mil; JLCPCB Part Class: Basic Part; Datasheet: https://atta.szlcsc.com/upload/public/pdf/source/20170316/1489627409956.pdf; Supplier: LCSC; Interface Type: SPI; Memory Size: 128Mbit; Clock Frequency (fc): 133MHz; Supply Voltage: 2.7V~3.6V; Page Programming Time (Tpp): 700us; Block Erase Time (tBE): 120ms@(32KB); Data Retention - TDR (Year): 20 years; Operating Temperature: -40℃~+85℃
U27 = PE3828-M: Encapsulated Transformer
USB3 = TYPE-C 16PIN 2MD(073): Connector Type:Type-C Standard:- Gender:Female Number of Contacts:16 Number of Ports:1 Mounting Style:Surface Mount Current Rating - Power (Max):5A Operating Temperature Range:-25℃~+85℃ Operating Temperature Range:-25℃~+85℃; LCSC Part Name: TYPE-C母座16P4脚插件带定位柱不锈钢外壳2次模顶; Supplier Part: C2765186; Manufacturer: SHOUHAN(首韩); Manufacturer Part: TYPE-C16PIN2MD(073); Supplier Footprint: SMD; JLCPCB Part Class: ExtendedPart; Supplier: LCSC; Connector Type: Type-C; Gender: Female; Number of Contacts: 16; Number of Ports: 1; Mounting Style: SurfaceMount; Current Rating - Power (Max): 5A; Operating Temperature Range: -25℃~+85℃
C44-C79 = CC0603JRX7R8BB334: Capacitance: Tolerance:±5% Tolerance:±5% Voltage Rated: Temperature Coefficient:; LCSC Part Name: 330nF ±5% 25V; Supplier Part: C519579; Manufacturer: YAGEO(国巨); Supplier Footprint: 0603; JLCPCB Part Class: Extended Part; Datasheet: https://atta.szlcsc.com/upload/public/pdf/source/20200423/C519579_4B49D28AF83F65C947DDDCA074933BB2.pdf; Supplier: LCSC; Tolerance: ±5%
CN21-CN38 = PJ-35825-SMT: Connector Type:3.5mm耳机座 Current Rating (Max):500mA Voltage Rating (Max):30V Operating Temperature Range:-30℃~+70℃ Operating Temperature Range:-30℃~+70℃ Soldering Temperature(Max):235℃; LCSC Part Name: 3.5mm耳机座; Supplier Part: C2764616; Manufacturer: XKB Connectivity(中国星坤); Supplier Footprint: SMD; JLCPCB Part Class: Extended Part; Datasheet: https://atta.szlcsc.com/upload/public/pdf/source/20211011/4237FE88CF1A511BFDFFABC5148D8FEA.pdf; Supplier: LCSC; Connector Type: 3.5mm耳机座; Current Rating (Max): 500mA; Voltage Rating (Max): 30V; Operating Temperature Range: -30℃~+70℃; Soldering Temperature(Max): 235℃
R31 R33 R35 R39 R41 R43 R47 R49 R51 R55 R57 R59 R63 R65 R67 R71 R73 R75 = RC0603FR-0722RL: Type:Thick Film Resistors Resistance: Tolerance:±1% Tolerance:±1% Power(Watts): Overload Voltage (Max): Temperature Coefficient:±100ppm/℃ Temperature Coefficient:±100ppm/℃ Operating Temperature Range:-55℃~+155℃ Operating Temperature Range:-55℃~+155℃; LCSC Part Name: 厚膜电阻 22Ω ±1% 100mW; Supplier Part: C107701; Manufacturer: YAGEO(国巨); Supplier Footprint: 0603; JLCPCB Part Class: Extended Part; Datasheet: https://atta.szlcsc.com/upload/public/pdf/source/20170914/C127450_1505359406912967677.pdf; Supplier: LCSC; Type: Thick Film Resistors; Tolerance: ±1%; Temperature Coefficient: ±100ppm/℃; Operating Temperature Range: -55℃~+155℃
R37 R38 R45 R46 R53 R54 R61 R62 R69 R70 R77 R78 = RC0603FR-07100RL: Type:Thick Film Resistors Resistance: Tolerance:±1% Tolerance:±1% Power(Watts): Overload Voltage (Max): Temperature Coefficient:±100ppm/℃ Temperature Coefficient:±100ppm/℃ Operating Temperature Range:-55℃~+155℃ Operating Temperature Range:-55℃~+155℃; LCSC Part Name: 厚膜电阻 100Ω ±1% 100mW; Supplier Part: C105588; Manufacturer: YAGEO(国巨); Supplier Footprint: 0603; JLCPCB Part Class: Extended Part; Datasheet: https://atta.szlcsc.com/upload/public/pdf/source/20180316/70C0E2BDAE7FCC62C531A5A58D202EE1.pdf; Supplier: LCSC; Type: Thick Film Resistors; Tolerance: ±1%; Temperature Coefficient: ±100ppm/℃; Operating Temperature Range: -55℃~+155℃
U29-U34 = TC164-JR-07100RL: Number of Resistors: Resistance: Tolerance:±5% Tolerance:±5% Power(Watts): Temperature Coefficient:±200ppm/℃ Temperature Coefficient:±200ppm/℃ Number of Pins:; LCSC Part Name: 100Ω ±5%; Supplier Part: C872279; Manufacturer: YAGEO(国巨); Supplier Footprint: 1206; JLCPCB Part Class: Extended Part; Datasheet: https://atta.szlcsc.com/upload/public/pdf/source/20211215/4FD9DBAA641461C0158FF8BE819EB67E.pdf; Supplier: LCSC; Tolerance: ±5%; Temperature Coefficient: ±200ppm/℃
C110-C127 C184-C201 = CC0603JRX7R9BB183: Capacitance: Tolerance:±5% Tolerance:±5% Voltage Rated: Temperature Coefficient:; LCSC Part Name: 18nF ±5% 50V; Supplier Part: C519551; Manufacturer: YAGEO(国巨); Supplier Footprint: 0603; JLCPCB Part Class: Extended Part; Datasheet: https://atta.szlcsc.com/upload/public/pdf/source/20200423/C519551_240BC035F5C8FC4A7107DC4CEA9A159A.pdf; Supplier: LCSC; Tolerance: ±5%
R186-R203 R212-R229 = RC0603FR-071KL: Type:Thick Film Resistors Resistance: Tolerance:±1% Tolerance:±1% Power(Watts): Overload Voltage (Max): Temperature Coefficient:±100ppm/℃ Temperature Coefficient:±100ppm/℃ Operating Temperature Range:-55℃~+155℃ Operating Temperature Range:-55℃~+155℃; LCSC Part Name: 厚膜电阻 1kΩ ±1% 100mW; Supplier Part: C22548; Manufacturer: YAGEO(国巨); Supplier Footprint: 0603; JLCPCB Part Class: Extended Part; Datasheet: https://atta.szlcsc.com/upload/public/pdf/source/20180316/70C0E2BDAE7FCC62C531A5A58D202EE1.pdf; Supplier: LCSC; Type: Thick Film Resistors; Tolerance: ±1%; Temperature Coefficient: ±100ppm/℃; Operating Temperature Range: -55℃~+155℃
R230-R247 = RT0603BRD0768KL: Type:Thin Film Resistor Resistance: Tolerance:±0.1% Tolerance:±0.1% Power(Watts): Overload Voltage (Max): Temperature Coefficient:±25ppm/℃ Temperature Coefficient:±25ppm/℃ Operating Temperature Range:-55℃~+155℃ Operating Temperature Range:-55℃~+155℃; LCSC Part Name: 薄膜电阻 68kΩ ±0.1% 100mW; Supplier Part: C705793; Manufacturer: YAGEO(国巨); Supplier Footprint: 0603; JLCPCB Part Class: Extended Part; Datasheet: https://atta.szlcsc.com/upload/public/pdf/source/20200720/C705793_74CF18C888254F62669791AFBEACFAA9.pdf; Supplier: LCSC; Type: Thin Film Resistor; Tolerance: ±0.1%; Temperature Coefficient: ±25ppm/℃; Operating Temperature Range: -55℃~+155℃

## Nets
3V3: C14.2 C19.2 C20.2 C23.2 C24.2 C25.2 C26.2 C27.1 C32.2 C33.2 C34.2 C35.2 C36.2 CN20.6 L1.1 R22.2 R23.2 R30.2 U21.2 U22.20(VDD3P3_RTC) U22.46(VDD3P3_CPU) U22.55(VDDA) U22.56(VDDA) U24.1(VDD) ; also on sheet 4 5 6
5V: C42.2 C43.2 D9.5(VBUS) Q3.3(D) USB3.2(VBUS) USB3.11(VBUS)
GND: C9.2 C10.2 C11.1 C12.1 C14.1 C18.1 C19.1 C20.1 C21.1 C22.1 C23.1 C24.1 C25.1 C26.1 C27.2 C28.1 C29.1 C31.1 C32.1 C33.1 C34.1 C35.1 C36.1 C37.1 C38.1 C39.1 C40.1 C41.1 C42.1 C43.1 C44.2 C45.1 C46.2 C47.1 C48.2 C49.1 C50.2 C51.1 C52.2 C53.1 C54.2 C55.1 C56.2 C57.1 C58.2 C59.1 C60.2 C61.1 C62.2 C63.1 C64.2 C65.1 C66.2 C67.1 C68.2 C69.1 C70.2 C71.1 C72.2 C73.1 C74.2 C75.1 C76.2 C77.1 C78.2 C79.1 C110.1 C111.1 C112.1 C113.1 C114.1 C115.1 C116.1 C117.1 C118.1 C119.1 C120.1 C121.1 C122.1 C123.1 C124.1 C125.1 C126.1 C127.1 C184.1 C185.1 C186.1 C187.1 C188.1 C189.1 C190.1 C191.1 C192.1 C193.1 C194.1 C195.1 C196.1 C197.1 C198.1 C199.1 C200.1 C201.1 CN20.5 D7.3(-) D9.2(GND) R21.1 R25.1 R26.2 R29.1 R79.2 R186.1 R187.1 R188.1 R189.1 R190.1 R191.1 R192.1 R193.1 R194.1 R195.1 R196.1 R197.1 R198.1 R199.1 R200.1 R201.1 R202.1 R203.1 R212.1 R213.1 R214.1 R215.1 R216.1 R217.1 R218.1 R219.1 R220.1 R221.1 R222.1 R223.1 R224.1 R225.1 R226.1 R227.1 R228.1 R229.1 RF1.1(GND) RF1.2(GND) RF1.3(GND) RF1.4(GND) SW3.2 SW4.2 U19.2 U20.1(GND) U22.57(GND) U24.10(GND) U24.11(GND) U24.17(PAD) U25.2(GND) U25.4(GND) U26.4(GND) U28.2 USB3.1(GND) USB3.12(GND) USB3.13(SHELL) USB3.14(SHELL) ; also on sheet 4 5 6
V1N: C110.2 R186.2 ; also on sheet 4
V1P: C184.2 R229.2 R235.1 ; also on sheet 4
V2N: C111.2 R187.2 ; also on sheet 4
V2P: C185.2 R228.2 R234.1 ; also on sheet 4
V3N: C112.2 R188.2 ; also on sheet 4
V3P: C186.2 R227.2 R233.1 ; also on sheet 4
V4N: C113.2 R189.2 ; also on sheet 4
V4P: C187.2 R226.2 R232.1 ; also on sheet 4
V5N: C114.2 R190.2 ; also on sheet 4
V5P: C188.2 R225.2 R231.1 ; also on sheet 4
V6N: C115.2 R191.2 ; also on sheet 4
V6P: C189.2 R224.2 R230.1 ; also on sheet 4
V7N: C116.2 R192.2 ; also on sheet 5
V7P: C190.2 R223.2 R242.1 ; also on sheet 5
V8N: C117.2 R193.2 ; also on sheet 5
V8P: C191.2 R222.2 R243.1 ; also on sheet 5
V9N: C118.2 R194.2 ; also on sheet 5
V9P: C192.2 R221.2 R244.1 ; also on sheet 5
V10N: C119.2 R195.2 ; also on sheet 5
V10P: C193.2 R220.2 R245.1 ; also on sheet 5
V11N: C120.2 R196.2 ; also on sheet 5
V11P: C194.2 R219.2 R246.1 ; also on sheet 5
V12N: C121.2 R197.2 ; also on sheet 5
V12P: C195.2 R218.2 R247.1 ; also on sheet 5
V13N: C122.2 R198.2 ; also on sheet 6
V13P: C196.2 R212.2 R241.1 ; also on sheet 6
V14N: C123.2 R199.2 ; also on sheet 6
V14P: C197.2 R213.2 R240.1 ; also on sheet 6
V15N: C124.2 R200.2 ; also on sheet 6
V15P: C198.2 R214.2 R239.1 ; also on sheet 6
V16N: C125.2 R201.2 ; also on sheet 6
V16P: C199.2 R215.2 R238.1 ; also on sheet 6
V17N: C126.2 R202.2 ; also on sheet 6
V17P: C200.2 R216.2 R237.1 ; also on sheet 6
V18N: C127.2 R203.2 ; also on sheet 6
V18P: C201.2 R217.2 R236.1 ; also on sheet 6
VCC: C9.1 C10.1 D7.1(+) D8.2(A) Q3.1(G) R29.2 U19.1
VDD_SPI: C31.2 C37.2 C38.2 C39.2 U22.29(VDD_SPI) U26.8(VCC)
VIN: C11.2 C12.2 C40.2 D8.1(K) Q3.2(S) U20.3(VIN) U20.5(EN) U28.1
AC9V_N: D7.4(AC) R79.1 U27.9
AC9V_P: D7.2(AC) R230.2 R231.2 R232.2 R233.2 R234.2 R235.2 R236.2 R237.2 R238.2 R239.2 R240.2 R241.2 R242.2 R243.2 R244.2 R245.2 R246.2 R247.2 U27.7
ANT1: C15.2 U23.1
ANT2: C16.2 RF1.5(IN)
ANT_CTRL: C18.2 U22.6(GPIO1) U24.2(VCTL)
ANT_EN: C21.2 R23.1 U22.7(GPIO2) U24.5(EN)
CS1: U22.10(GPIO5) ; also on sheet 4
CS2: U22.11(GPIO6) ; also on sheet 4
CS3: U22.12(GPIO7) ; also on sheet 5
CS4: U22.13(GPIO8) ; also on sheet 5
CS5: U22.14(GPIO9) ; also on sheet 6
CS6: U22.15(GPIO10) ; also on sheet 6
ESP_EN: C41.2 CN20.1 R30.1 SW4.1 U22.4(CHIP_PU)
GPIO0: CN20.2 SW3.1 U22.5(GPIO0)
I1+: CN21.2 R31.1 U29.4
I1-: CN21.1 R32.2 U29.3
I1N: C45.2 U29.6 ; also on sheet 4
I1P: C44.1 U29.5 ; also on sheet 4
I2+: CN22.2 R33.1 U29.2
I2-: CN22.1 R34.2 U29.1
I2N: C47.2 U29.8 ; also on sheet 4
I2P: C46.1 U29.7 ; also on sheet 4
I3+: CN23.2 R35.1 R37.1
I3-: CN23.1 R36.2 R38.1
I3N: C49.2 R38.2 ; also on sheet 4
I3P: C48.1 R37.2 ; also on sheet 4
I4+: CN24.2 R39.1 U30.4
I4-: CN24.1 R40.2 U30.3
I4N: C51.2 U30.6 ; also on sheet 4
I4P: C50.1 U30.5 ; also on sheet 4
I5+: CN25.2 R41.1 U30.2
I5-: CN25.1 R42.2 U30.1
I5N: C53.2 U30.8 ; also on sheet 4
I5P: C52.1 U30.7 ; also on sheet 4
I6+: CN26.2 R43.1 R45.1
I6-: CN26.1 R44.2 R46.1
I6N: C55.2 R46.2 ; also on sheet 4
I6P: C54.1 R45.2 ; also on sheet 4
I7+: CN27.2 R47.1 U31.4
I7-: CN27.1 R48.2 U31.3
I7N: C57.2 U31.6 ; also on sheet 5
I7P: C56.1 U31.5 ; also on sheet 5
I8+: CN28.2 R49.1 U31.2
I8-: CN28.1 R50.2 U31.1
I8N: C59.2 U31.8 ; also on sheet 5
I8P: C58.1 U31.7 ; also on sheet 5
I9+: CN29.2 R51.1 R53.1
I9-: CN29.1 R52.2 R54.1
I9N: C61.2 R54.2 ; also on sheet 5
I9P: C60.1 R53.2 ; also on sheet 5
I10+: CN30.2 R55.1 U32.1
I10-: CN30.1 R56.2 U32.2
I10N: C63.2 U32.7 ; also on sheet 5
I10P: C62.1 U32.8 ; also on sheet 5
I11+: CN31.2 R57.1 U32.3
I11-: CN31.1 R58.2 U32.4
I11N: C65.2 U32.5 ; also on sheet 5
I11P: C64.1 U32.6 ; also on sheet 5
I12+: CN32.2 R59.1 R61.1
I12-: CN32.1 R60.2 R62.1
I12N: C67.2 R62.2 ; also on sheet 5
I12P: C66.1 R61.2 ; also on sheet 5
I13+: CN33.2 R63.1 U33.1
I13-: CN33.1 R64.2 U33.2
I13N: C69.2 U33.7 ; also on sheet 6
I13P: C68.1 U33.8 ; also on sheet 6
I14+: CN34.2 R65.1 U33.3
I14-: CN34.1 R66.2 U33.4
I14N: C71.2 U33.5 ; also on sheet 6
I14P: C70.1 U33.6 ; also on sheet 6
I15+: CN35.2 R67.1 R69.1
I15-: CN35.1 R68.2 R70.1
I15N: C73.2 R70.2 ; also on sheet 6
I15P: C72.1 R69.2 ; also on sheet 6
I16+: CN36.2 R71.1 U34.1
I16-: CN36.1 R72.2 U34.2
I16N: C75.2 U34.7 ; also on sheet 6
I16P: C74.1 U34.8 ; also on sheet 6
I17+: CN37.2 R73.1 U34.3
I17-: CN37.1 R74.2 U34.4
I17N: C77.2 U34.5 ; also on sheet 6
I17P: C76.1 U34.6 ; also on sheet 6
I18+: CN38.2 R75.1 R77.1
I18-: CN38.1 R76.2 R78.1
I18N: C79.2 R78.2 ; also on sheet 6
I18P: C78.1 R77.2 ; also on sheet 6
IRQ1_0: U22.27(GPIO21) ; also on sheet 4
IRQ2_0: U22.36(SPICLK_N) ; also on sheet 4
IRQ3_0: U22.37(SPICLK_P) ; also on sheet 5
IRQ4_0: U22.43(GPIO38) ; also on sheet 5
IRQ5_0: U22.44(MTCK) ; also on sheet 6
IRQ6_0: U22.45(MTDO) ; also on sheet 6
LNA_IN: C17.1 U22.1(LNA_IN)
MISO: U22.18(GPIO13) ; also on sheet 4 5 6
MOSI: U22.16(GPIO11) ; also on sheet 4 5 6
SCLK: U22.17(GPIO12) ; also on sheet 4 5 6
SPICLK: U22.33(SPICLK) U26.6(CLK)
SPICS0: U22.32(SPICS0) U26.1(CS#)
SPID: U22.35(SPID) U26.5(DI)
SPIHD: U22.30(SPIHD) U26.7(IO3)
SPIQ: U22.34(SPIQ) U26.2(DO)
SPIWP: U22.31(SPIWP) U26.3(IO2)
U0RXD: CN20.3 U22.50(U0RXD)
U0TXD: CN20.4 R24.2
USB_D_N: D9.4(IO2) USB3.5(DN2) USB3.7(DN1)
USB_D_P: D9.6(IO1) USB3.6(DP1) USB3.8(DP2)
WARN1: U22.9(GPIO4) ; also on sheet 4
WARN2: U22.19(GPIO14) ; also on sheet 4
WARN3: U22.21(XTAL_32K_P) ; also on sheet 5
WARN4: U22.22(XTAL_32K_N) ; also on sheet 5
WARN5: U22.23(GPIO17) ; also on sheet 6
WARN6: U22.24(GPIO18) ; also on sheet 6
XTAL_N: C29.2 U22.53(XTAL_N) U25.3
XTAL_P: C28.2 L2.2 U25.1
$1N5594: C13.2 U20.2(SW) U21.1
$1N5607: C13.1 U20.6(CB)
$1N6009: R21.2 R22.1 U20.4(FB)
$1N7067: C16.1 U24.12(RF2)
$1N7124: C17.2 U24.3(RFC)
$1N7128: C15.1 U24.9(RF1)
$1N8178: C22.2 L1.2 U22.2(VDD3P3) U22.3(VDD3P3)
$1N8709: L2.1 U22.54(XTAL_P)
$1N9552: R24.1 U22.49(U0TXD)
$1N10878: R27.2 U22.25(GPIO19)
$1N10922: R28.2 U22.26(GPIO20)
$1N13760: FH1.2 U27.1
$1N13764: CN19.1 FH1.1
$1N13771: CN19.2 U27.5
$1N20955: D9.3(IO2) R27.1
$1N20967: D9.1(IO1) R28.1
$1N30615: R26.1 USB3.4(CC1)
$1N30657: R25.2 USB3.10(CC2)
$2N3502: R31.2 R32.1
$2N3781: R33.2 R34.1
$2N4022: R35.2 R36.1
$2N4873: R39.2 R40.1
$2N4901: R41.2 R42.1
$2N4941: R43.2 R44.1
$2N5561: R47.2 R48.1
$2N5589: R49.2 R50.1
$2N5629: R51.2 R52.1
$2N6249: R55.2 R56.1
$2N6277: R57.2 R58.1
$2N6317: R59.2 R60.1
$2N6937: R63.2 R64.1
$2N6965: R65.2 R66.1
$2N7005: R67.2 R68.1
$2N7625: R71.2 R72.1
$2N7653: R73.2 R74.1
$2N7693: R75.2 R76.1

Not connected (* = marked no-connect by the designer): CN20 0*; CN21 3 4; CN22 3 4; CN23 3 4; CN24 3 4; CN25 3 4; CN26 3 4; CN27 3 4; CN28 3 4; CN29 3 4; CN30 3 4; CN31 3 4; CN32 3 4; CN33 3 4; CN34 3 4; CN35 3 4; CN36 3 4; CN37 3 4; CN38 3 4; U22 8(GPIO3)* 28(SPICS1)* 38(GPIO33)* 39(GPIO34)* 40(GPIO35)* 41(GPIO36)* 42(GPIO37)* 47(MTDI) 48(MTMS) 51(GPIO45)* 52(GPIO46)*; U23 2*; U24 4(NC)* 6(NC)* 7(NC)* 8(NC)* 13(NC)* 14(NC)* 15(NC)* 16(NC)*; U27 6* 10*; USB3 3(SBU2) 9(SBU1)

## Notes on the sheets
sheet 1
- STEP DOWN CONVERTER
- AC INPUT
- VOLTAGE ORING
- ANTENNA SWITCH
- ESP32-S3
- USB PORT
- CRYSTAL
- FLASH
sheet 2
- CT SUPPORT
- CT CONNECTORS
- 50A CTs
- 200A CTs
sheet 3
- AC VOLTAGE SUPPORT
